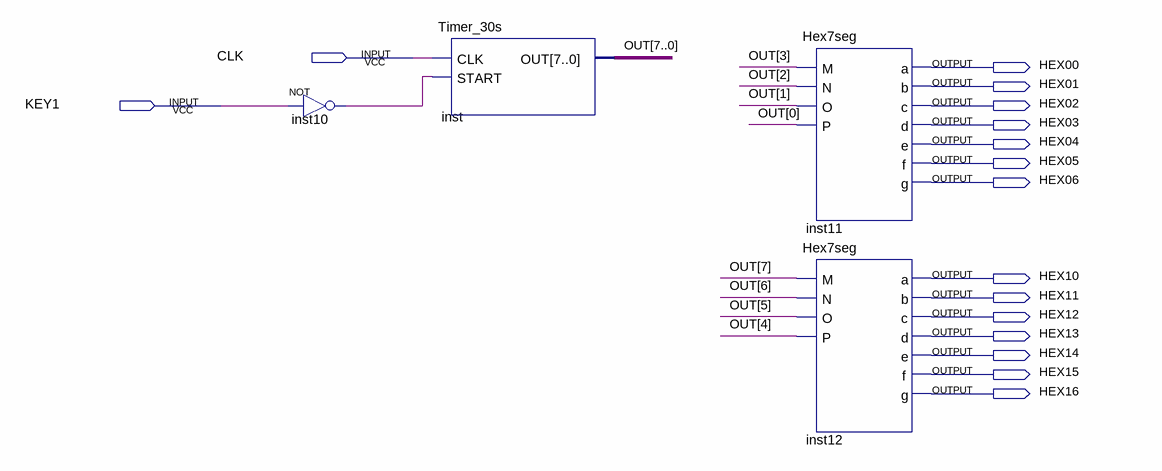
[diagram p0: schematic sheet]
// Quartus schematic Lab2-1.bdf as structural Verilog: 4 symbols, 16 pins
module \Lab2-1  (
  input  CLK,
  input  KEY1,
  output HEX00,
  output HEX01,
  output HEX02,
  output HEX03,
  output HEX04,
  output HEX05,
  output HEX06,
  output HEX10,
  output HEX11,
  output HEX12,
  output HEX13,
  output HEX14,
  output HEX15,
  output HEX16
);

  wire inst10_out;
  wire [7:0] OUT;

  not inst10 (inst10_out, KEY1);
  Timer_30s inst (.CLK(CLK), .START(inst10_out), .OUT(OUT));
  Hex7seg inst11 (
    .M(OUT[3]), .N(OUT[2]), .O(OUT[1]), .P(OUT[0]), .a(HEX00), .b(HEX01), .c(HEX02), .d(HEX03), .e(HEX04),
    .f(HEX05), .g(HEX06));
  Hex7seg inst12 (
    .M(OUT[7]), .N(OUT[6]), .O(OUT[5]), .P(OUT[4]), .a(HEX10), .b(HEX11), .c(HEX12), .d(HEX13), .e(HEX14),
    .f(HEX15), .g(HEX16));
endmodule
